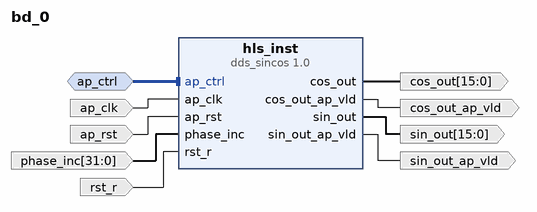
[diagram p0: block diagram of the top level]
# Vivado block design bd_0, xczu5eg-sfvc784-1-e, Vivado 2023.1
create_bd_design bd_0

create_bd_intf_port -mode Slave -vlnv xilinx.com:interface:acc_handshake_rtl:1.0 ap_ctrl
create_bd_port -dir I -type clk ap_clk
set_property -dict {CONFIG.FREQ_HZ 100000000.0} [get_bd_ports ap_clk]
create_bd_port -dir I -type rst ap_rst
set_property -dict {CONFIG.POLARITY ACTIVE_HIGH} [get_bd_ports ap_rst]
create_bd_port -dir O -from 15 -to 0 -type data cos_out
create_bd_port -dir O cos_out_ap_vld
create_bd_port -dir I -from 31 -to 0 -type data phase_inc
create_bd_port -dir I -type data rst_r
create_bd_port -dir O -from 15 -to 0 -type data sin_out
create_bd_port -dir O sin_out_ap_vld

create_bd_cell -type ip -vlnv xilinx.com:hls:dds_sincos:1.0 hls_inst

# ---- connections ----

connect_bd_intf_net -intf_net ap_ctrl_0_1 [get_bd_intf_ports ap_ctrl] [get_bd_intf_pins hls_inst/ap_ctrl]
connect_bd_net -net ap_clk_0_1 [get_bd_ports ap_clk] [get_bd_pins hls_inst/ap_clk]
connect_bd_net -net ap_rst_0_1 [get_bd_ports ap_rst] [get_bd_pins hls_inst/ap_rst]
connect_bd_net [get_bd_pins hls_inst/cos_out] [get_bd_ports cos_out]
connect_bd_net [get_bd_pins hls_inst/cos_out_ap_vld] [get_bd_ports cos_out_ap_vld]
connect_bd_net [get_bd_pins hls_inst/sin_out] [get_bd_ports sin_out]
connect_bd_net [get_bd_pins hls_inst/sin_out_ap_vld] [get_bd_ports sin_out_ap_vld]
connect_bd_net -net phase_inc_0_1 [get_bd_ports phase_inc] [get_bd_pins hls_inst/phase_inc]
connect_bd_net -net rst_r_0_1 [get_bd_ports rst_r] [get_bd_pins hls_inst/rst_r]

validate_bd_design
save_bd_design
